# Altium schematic sheet MONO65_A2_s03 [MCU].SchDoc
size A3; DocumentNumber: 3; SheetNumber: 3; SheetTotal: 7
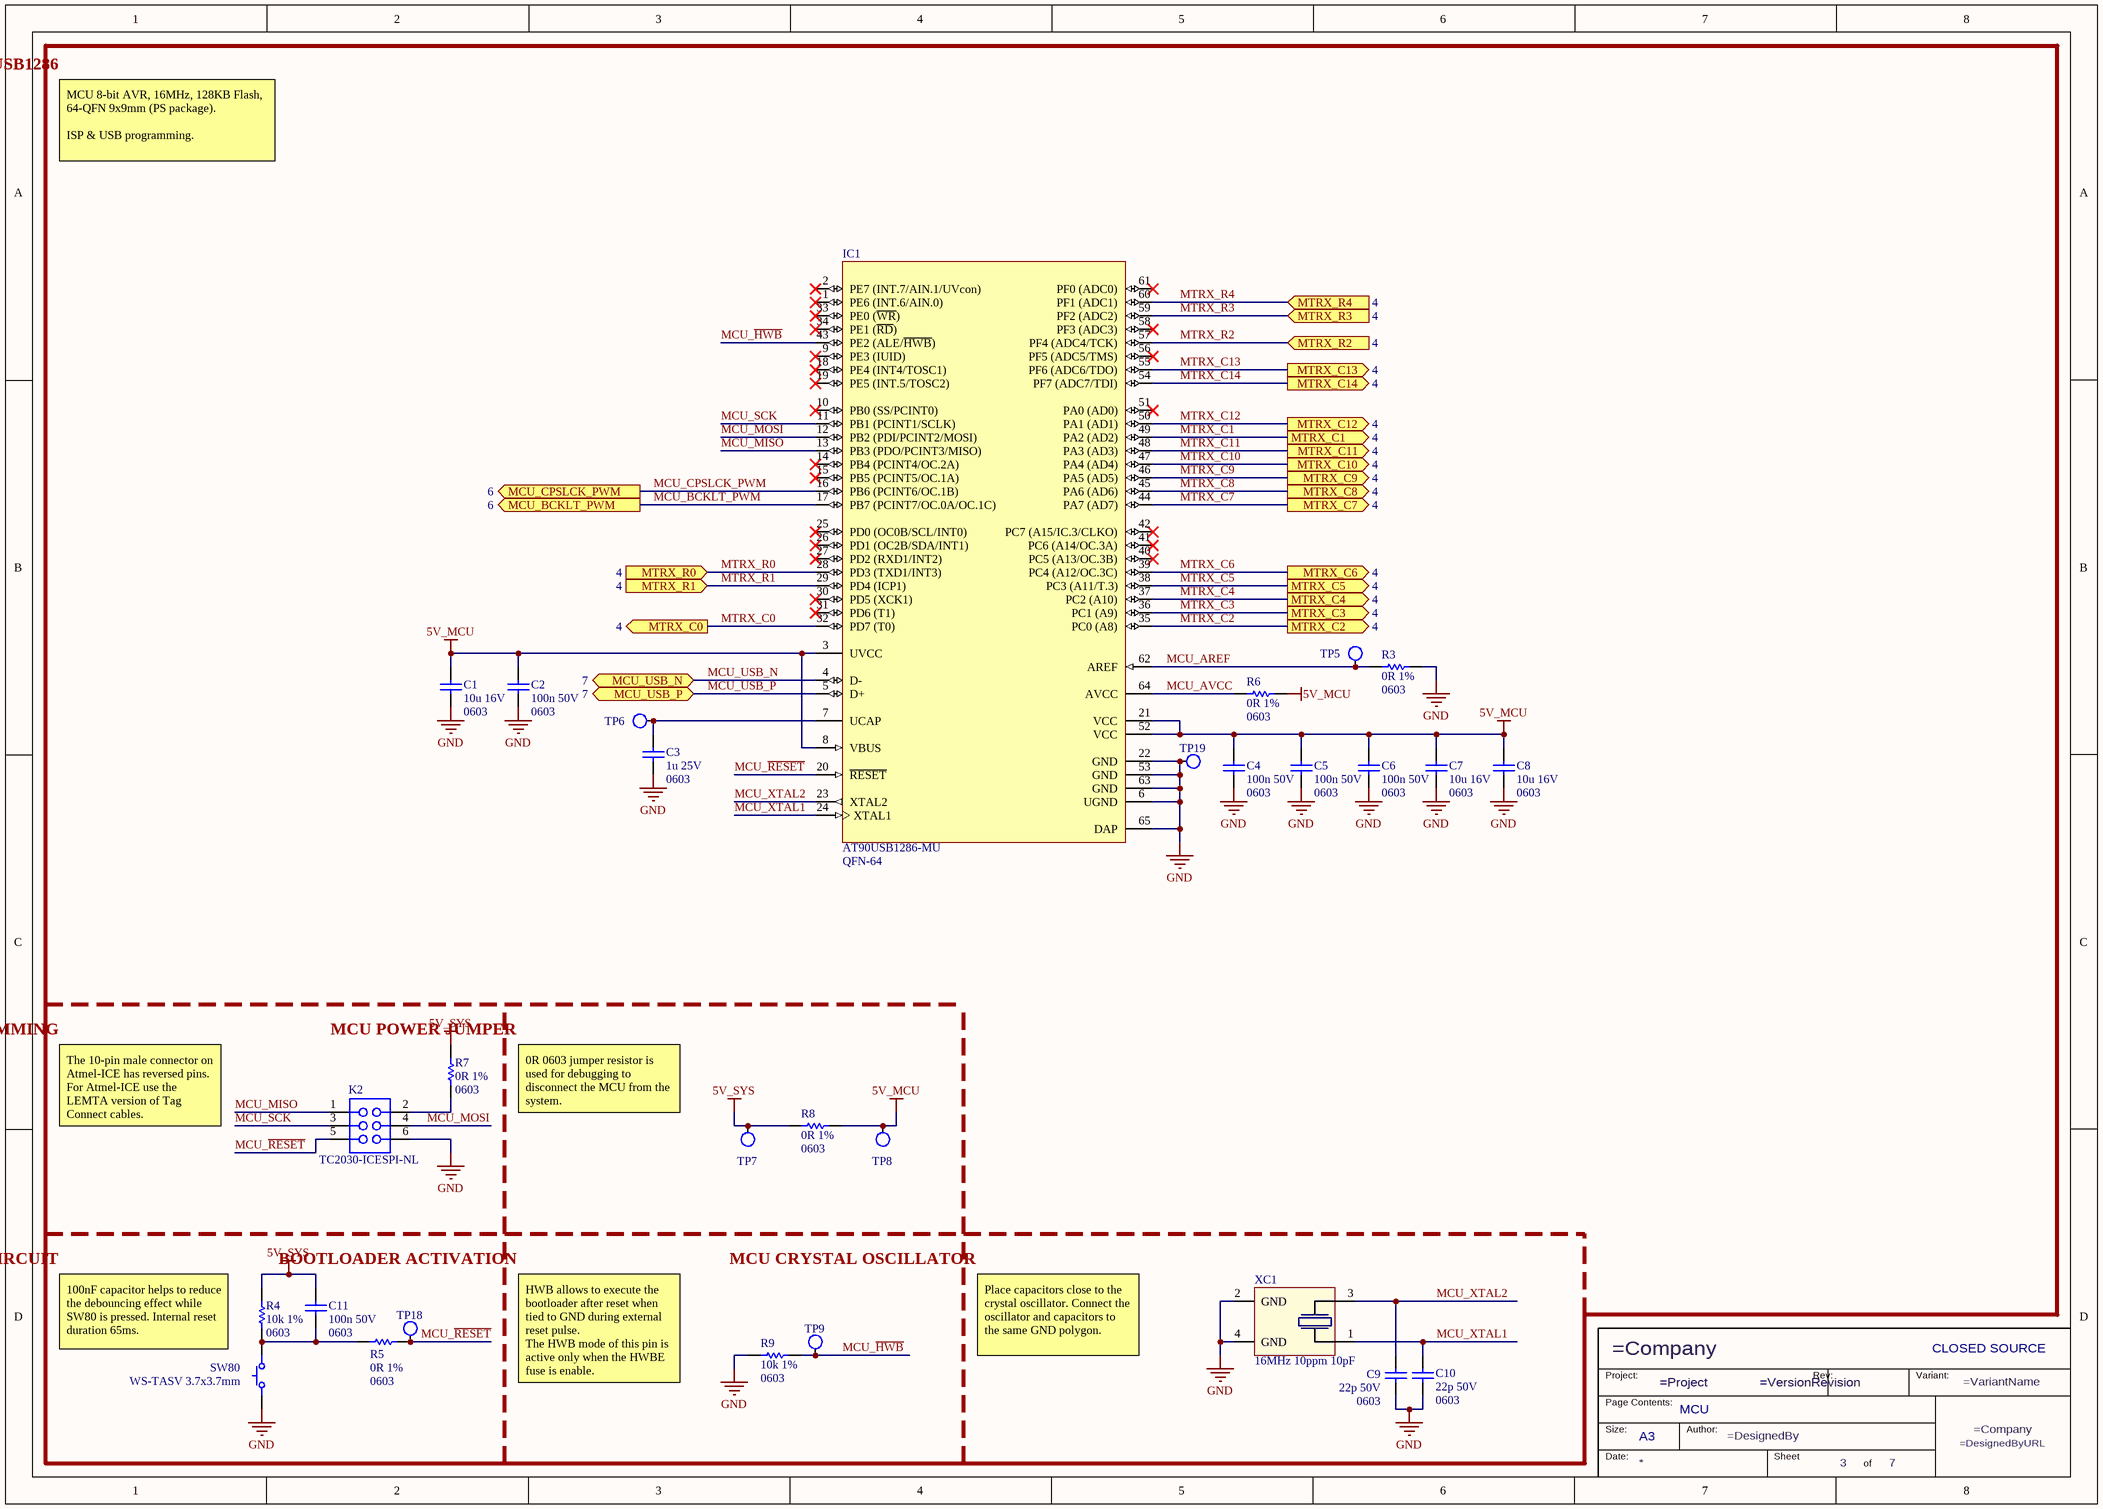
[diagram p0: MONO65_A2_s03 [MCU].SchDoc]

## Parts
C1  10u 16V  Case/Package: 0603  [CAPC1608X08N]
C2  100n 50V  Case/Package: 0603  [CAPC1608X08N]
C3  1u 25V  Case/Package: 0603  [CAPC1608X08N]
C4  100n 50V  Case/Package: 0603  [CAPC1608X08N]
C5  100n 50V  Case/Package: 0603  [CAPC1608X08N]
C6  100n 50V  Case/Package: 0603  [CAPC1608X08N]
C7  10u 16V  Case/Package: 0603  [CAPC1608X08N]
C8  10u 16V  Case/Package: 0603  [CAPC1608X08N]
C9  22p 50V  Case/Package: 0603  [CAPC1608X08N]
C10  22p 50V  Case/Package: 0603  [CAPC1608X08N]
C11  100n 50V  Case/Package: 0603  [CAPC1608X08N]
IC1  AT90USB1286-MU  Case/Package: QFN-64  [QFN50P900X900X100_HS-65N]
K2  TC2030-ICESPI-NL  [TC2030-6pin-NL]  (no BOM)
R3  0R 1%  Case/Package: 0603  [RESC1608X04N]
R4  10k 1%  Case/Package: 0603  [RESC1608X04N]
R5  0R 1%  Case/Package: 0603  [RESC1608X04N]
R6  0R 1%  Case/Package: 0603  [RESC1608X04N]
R7  0R 1%  Case/Package: 0603  [RESC1608X04N]
R8  0R 1%  Case/Package: 0603  [RESC1608X04N]
R9  10k 1%  Case/Package: 0603  [RESC1608X04N]
SW80  WS-TASV 3.7x3.7mm  [SWC WS-TASV J-Bend 3.7x3.7mm]
TB*?  PageContents: MCU  Licence: CLOSED SOURCE  Size: A3  (hidden comment: TBL TitleBlock 01)  (graphical)
TP5  TP SMD 0.6mm  [TP SMD 0.6mm]  (value not drawn)  (no BOM)
TP6  TP SMD 0.6mm  [TP SMD 0.6mm]  (value not drawn)  (no BOM)
TP7  TP SMD 0.6mm  [TP SMD 0.6mm]  (value not drawn)  (no BOM)
TP8  TP SMD 0.6mm  [TP SMD 0.6mm]  (value not drawn)  (no BOM)
TP9  TP SMD 0.6mm  [TP SMD 0.6mm]  (value not drawn)  (no BOM)
TP18  TP SMD 0.6mm  [TP SMD 0.6mm]  (value not drawn)  (no BOM)
TP19  TP SMD 0.6mm  [TP SMD 0.6mm]  (value not drawn)  (no BOM)
XC1  16MHz 10ppm 10pF  [Crystal Oscillator SMD 3225]

## Ports
MCU_BCKLT_PWM (out, see 6), MCU_CPSLCK_PWM (out, see 6), MCU_USB_N (bidir, see 7), MCU_USB_P (bidir, see 7), MTRX_C0 (out, see 4), MTRX_C1 (out, see 4), MTRX_C2 (out, see 4), MTRX_C3 (out, see 4), MTRX_C4 (out, see 4), MTRX_C5 (out, see 4), MTRX_C6 (out, see 4), MTRX_C7 (out, see 4), MTRX_C8 (out, see 4), MTRX_C9 (out, see 4), MTRX_C10 (out, see 4), MTRX_C11 (out, see 4), MTRX_C12 (out, see 4), MTRX_C13 (out, see 4), MTRX_C14 (out, see 4), MTRX_R0 (in, see 4), MTRX_R1 (in, see 4), MTRX_R2 (in, see 4), MTRX_R3 (in, see 4), MTRX_R4 (in, see 4)

## Nets
5V_MCU: C1.1 C2.1 C4.1 C5.1 C6.1 C7.1 C8.1 IC1.3(UVCC) IC1.8(VBUS) IC1.21(VCC) IC1.52(VCC) R6.2 R8.2 TP8.1
5V_SYS: C11.1 R4.1 R7.1 R8.1 TP7.1
GND: C1.2 C2.2 C3.2 C4.2 C5.2 C6.2 C7.2 C8.2 C9.2 C10.2 IC1.6(UGND) IC1.22(GND) IC1.53(GND) IC1.63(GND) IC1.65(DAP) K2.6 R3.2 R9.1 SW80.2 TP19.1 XC1.2(GND) XC1.4(GND)
MCU_AREF: IC1.62(AREF) R3.1 TP5.1
MCU_AVCC: IC1.64(AVCC) R6.1
MCU_BCKLT_PWM: IC1.17(PB7_(PCINT7/OC.0A/OC.1C)) ; port MCU_BCKLT_PWM
MCU_CPSLCK_PWM: IC1.16(PB6_(PCINT6/OC.1B)) ; port MCU_CPSLCK_PWM
MCU_~{HWB}: IC1.43(PE2_(ALE/~{HWB})) R9.2 TP9.1
MCU_MISO: IC1.13(PB3_(PDO/PCINT3/MISO)) K2.1
MCU_MOSI: IC1.12(PB2_(PDI/PCINT2/MOSI)) K2.4
MCU_~{RESET}: IC1.20(~{RESET}) K2.5 R5.2 TP18.1
MCU_SCK: IC1.11(PB1_(PCINT1/SCLK)) K2.3
MCU_USB_N: IC1.4(D-) ; port MCU_USB_N
MCU_USB_P: IC1.5(D+) ; port MCU_USB_P
MCU_XTAL1: C10.1 IC1.24(XTAL1) XC1.1
MCU_XTAL2: C9.1 IC1.23(XTAL2) XC1.3
MTRX_C0: IC1.32(PD7_(T0)) ; port MTRX_C0
MTRX_C1: IC1.49(PA2_(AD2)) ; port MTRX_C1
MTRX_C2: IC1.35(PC0_(A8)) ; port MTRX_C2
MTRX_C3: IC1.36(PC1_(A9)) ; port MTRX_C3
MTRX_C4: IC1.37(PC2_(A10)) ; port MTRX_C4
MTRX_C5: IC1.38(PC3_(A11/T.3)) ; port MTRX_C5
MTRX_C6: IC1.39(PC4_(A12/OC.3C)) ; port MTRX_C6
MTRX_C7: IC1.44(PA7_(AD7)) ; port MTRX_C7
MTRX_C8: IC1.45(PA6_(AD6)) ; port MTRX_C8
MTRX_C9: IC1.46(PA5_(AD5)) ; port MTRX_C9
MTRX_C10: IC1.47(PA4_(AD4)) ; port MTRX_C10
MTRX_C11: IC1.48(PA3_(AD3)) ; port MTRX_C11
MTRX_C12: IC1.50(PA1_(AD1)) ; port MTRX_C12
MTRX_C13: IC1.55(PF6_(ADC6/TDO)) ; port MTRX_C13
MTRX_C14: IC1.54(PF7_(ADC7/TDI)) ; port MTRX_C14
MTRX_R0: IC1.28(PD3_(TXD1/INT3)) ; port MTRX_R0
MTRX_R1: IC1.29(PD4_(ICP1)) ; port MTRX_R1
MTRX_R2: IC1.57(PF4_(ADC4/TCK)) ; port MTRX_R2
MTRX_R3: IC1.59(PF2_(ADC2)) ; port MTRX_R3
MTRX_R4: IC1.60(PF1_(ADC1)) ; port MTRX_R4
NetC3_1: C3.1 IC1.7(UCAP) TP6.1
NetC11_2: C11.2 R4.2 R5.1 SW80.1
NetK2_2: K2.2 R7.2

Not connected (* = marked no-connect by the designer): IC1 1(PE6_(INT.6/AIN.0))* 2(PE7_(INT.7/AIN.1/UVcon))* 9(PE3_(IUID))* 10(PB0_(SS/PCINT0))* 14(PB4_(PCINT4/OC.2A))* 15(PB5_(PCINT5/OC.1A))* 18(PE4_(INT4/TOSC1))* 19(PE5_(INT.5/TOSC2))* 25(PD0_(OC0B/SCL/INT0))* 26(PD1_(OC2B/SDA/INT1))* 27(PD2_(RXD1/INT2))* 30(PD5_(XCK1))* 31(PD6_(T1))* 33(PE0_(~{WR}))* 34(PE1_(~{RD}))* 40(PC5_(A13/OC.3B))* 41(PC6_(A14/OC.3A))* 42(PC7_(A15/IC.3/CLKO))* 51(PA0_(AD0))* 56(PF5_(ADC5/TMS))* 58(PF3_(ADC3))* 61(PF0_(ADC0))*

## Notes on the sheet
- MCU AT90USB1286
- MCU 8-bit AVR, 16MHz, 128KB Flash, 64-QFN 9x9mm (PS package).
  ISP & USB programming.
- ISP (SPI) PROGRAMMING
- MCU POWER JUMPER
- The 10-pin male connector on Atmel-ICE has reversed pins. For Atmel-ICE use the LEMTA version of Tag Connect cables.
- 0R 0603 jumper resistor is used for debugging to disconnect the MCU from the system.
- MCU RESET CIRCUIT
- BOOTLOADER ACTIVATION
- MCU CRYSTAL OSCILLATOR
- 100nF capacitor helps to reduce the debouncing effect while SW80 is pressed. Internal reset duration 65ms.
- HWB allows to execute the bootloader after reset when tied to GND during external
  reset pulse.
  The HWB mode of this pin is active only when the HWBE fuse is enable.
- Place capacitors close to the crystal oscillator. Connect the oscillator and capacitors to the same GND polygon.
- (in symbol TBL TitleBlock 01) Project:; Rev:; Variant:; Page Contents:; Size:; Author:; Date:; Sheet; of

## Library data of the parts
C1 C7 C8 = CAP SMD CER 10u 16V X5R 0603: SMD CAPACITOR,10u, 16V, X5R, 0603; Manufacturer: Murata; Manufacturer Part Number: GRM188R61C106MA73D; Capacitance: 10uF; Tolerance: 20%; Supplier 1: Digi-Key; Stock 1: 24451; Pricing 1: 1 = 0,31000, 10 = 0,21500, 50 = 0,14340, 100 = 0,12190, 500 = 0,08604, 1000 = 0,07528 (USD); RoHS: Yes; Mount: Surface Mount; Case Code (Metric): 1608; Case Code (Imperial): 0603; Min Operating Temperature: -55°C; Max Operating Temperature: 85°C; Package Quantity: 4000; Packaging: Tape and Reel; Voltage Rating: 16V; Dielectric: X5R; Voltage: 16V; Voltage Rating (DC): 16V; Series: GRM; Length: 1.6mm; Width: 0.031inch; Height: 0.8mm; Thickness: 0.031inch; Depth: 0.8mm; REACH SVHC: No SVHC; Lead Free: Lead Free; RoHS Compliant: Yes; ComponentLink1URL: https://datasheet.ciiva.com/46444/1769893-46444981.pdf?src-supplier=Element14; ComponentLink1Description: https://datasheet.ciiva.com/46444/1769893-46444981.pdf?src-supplier=Element14; ComponentLink2URL: https://datasheet.ciiva.com/14906/partnumbering-e-01-14906479.pdf?src-supplier=Digi-Key; ComponentLink2Description: https://datasheet.ciiva.com/14906/partnumbering-e-01-14906479.pdf?src-supplier=Digi-Key; Supplier Part Number 1: 490-7201-1-ND
C2 C4-C6 C11 = CAP SMD CER 100n 50V X7R 0603: SMD CAPACITOR, 100n, 50V, X7R, 0603; Manufacturer: TDK; Manufacturer Part Number: CGA3E2X7R1H104K080AA; Capacitance: 100nF; Tolerance: 10%; Supplier 1: Digi-Key; Stock 1: 8773520; Pricing 1: 1 = 0,11000, 10 = 0,07900, 100 = 0,03510, 500 = 0,02510, 1000 = 0,01972 (USD); RoHS: Yes; Mount: Surface Mount; Weight: 7.1E-05oz; Case Code (Imperial): 0603; Case Code (Metric): 1608; Min Operating Temperature: -55°C; Max Operating Temperature: 125°C; Packaging: Tape and Reel; Voltage Rating: 50V; Dielectric: X7R; Package Quantity: 1; Termination: SMD/SMT; Voltage Rating (DC): 50V; Voltage: 50V; Composition: Ceramic; Length: 1.6mm; Height: 0.8mm; Width: 0.8mm; Thickness: 0.035inch; Depth: 0.8mm; Ratings: AEC-Q200; Radiation Hardening: No; REACH SVHC: No SVHC; Lead Free: Lead Free; ComponentLink1URL: https://datasheet.ciiva.com/24216/cga3e2x7r1h104k080aa-266291-24216208.pdf?src-supplier=Mouser; ComponentLink1Description: https://datasheet.ciiva.com/24216/cga3e2x7r1h104k080aa-266291-24216208.pdf?src-supplier=Mouser; ComponentLink2URL: https://datasheet.ciiva.com/15192/getdatasheetpartid-715867-15192412.pdf?src-supplier=Verical; ComponentLink2Description: https://datasheet.ciiva.com/15192/getdatasheetpartid-715867-15192412.pdf?src-supplier=Verical; ComponentLink3URL: https://datasheet.ciiva.com/16500/mlccspec-automotive-general-midvoltage-en-16500693.pdf?src-supplier=Future+Electronics; ComponentLink3Description: https://datasheet.ciiva.com/16500/mlccspec-automotive-general-midvoltage-en-16500693.pdf?src-supplier=Future+Electronics; ComponentLink4URL: https://datasheet.ciiva.com/22725/1735392-22725642.pdf?src-supplier=Element14; ComponentLink4Description: https://datasheet.ciiva.com/22725/1735392-22725642.pdf?src-supplier=Element14; ComponentLink5URL: https://datasheet.ciiva.com/23803/1936565-23803084.pdf?src-supplier=Newark; ComponentLink5Description: https://datasheet.ciiva.com/23803/1936565-23803084.pdf?src-supplier=Newark; ComponentLink6URL: https://datasheet.ciiva.com/46385/1735392-46385708.pdf?src-supplier=Element14; ComponentLink6Description: https://datasheet.ciiva.com/46385/1735392-46385708.pdf?src-supplier=Element14; Supplier Part Number 1: 445-5666-1-ND
C3 = CAP SMD CER 1u 25V X7R 0603: SMD CAPACITOR, 1µF, 25V, X7R, 0603; Manufacturer: KEMET; Manufacturer Part Number: C0603C105K3RACTU; Dielectric Material: Ceramic; Capacitance: 1uF; Tolerance: 10%; Dissipation Factor: 5%; Supplier 1: Digi-Key; Stock 1: 271609; Pricing 1: 1 = 0,30000, 10 = 0,20900, 100 = 0,11830, 500 = 0,08350, 1000 = 0,07307 (USD); RoHS: Yes; Mount: Surface Mount; Case Code (Metric): 1608; Case Code (Imperial): 0603; Min Operating Temperature: -55°C; Max Operating Temperature: 125°C; Voltage Rating: 25V; Packaging: Tape and Reel; Dielectric: X7R; Voltage Rating (DC): 25V; Package Quantity: 1; Termination: SMD/SMT; Voltage: 25V; Length: 1.6mm; Height: 0.8mm; Width: 0.031inch; Thickness: 0.034inch; Depth: 0.8mm; REACH SVHC: No SVHC; ComponentLink1URL: https://datasheet.ciiva.com/7823/1851736-7823596.pdf?src-supplier=Element14; ComponentLink1Description: https://datasheet.ciiva.com/7823/1851736-7823596.pdf?src-supplier=Element14; Supplier Part Number 1: 399-7376-1-ND
C9 C10 = CAP SMD CER 22p 50V NP0 0603: SMD CAPACITOR, 22p, 50V, C0G/NP0, 0603; Manufacturer: Kyocera AVX; Manufacturer Part Number: 06035A220JAT2A; Dielectric Material: Ceramic; Capacitance: 22pF; Tolerance: 5%; Dielectric: C0G; Insulation Resistance: 100GR; Temperature Coefficient: 30ppm/°C; Supplier 1: Digi-Key; Stock 1: 1291683; Pricing 1: 1 = 0,10000, 10 = 0,05600, 50 = 0,03040, 100 = 0,02480, 500 = 0,01772, 1000 = 0,01392 (USD); RoHS: Yes; Mount: Surface Mount,PCB; Number of Pins: 2; Case Code (Imperial): 0603; Case Code (Metric): 1608; Contact Plating: Tin,Matte; Min Operating Temperature: -55°C; Max Operating Temperature: 125°C; Packaging: Tape and Reel; Voltage Rating: 50V; Voltage Rating (DC): 50V; Termination: SMD/SMT; Voltage: 50V; Package Quantity: 1; Length: 1.6mm; Width: 0.81mm; Height: 0.63mm; Thickness: 0.035inch; Depth: 0.81mm; Radiation Hardening: No; REACH SVHC: No SVHC; RoHS Compliant: Yes; Lead Free: Lead Free; ComponentLink1URL: https://datasheet.ciiva.com/11788/0900766b802d4697-11788031.pdf?src-supplier=RSComponents; ComponentLink1Description: https://datasheet.ciiva.com/11788/0900766b802d4697-11788031.pdf?src-supplier=RSComponents; ComponentLink2URL: https://datasheet.ciiva.com/16351/ccog-16351125.pdf?src-supplier=Future+Electronics; ComponentLink2Description: https://datasheet.ciiva.com/16351/ccog-16351125.pdf?src-supplier=Future+Electronics; ComponentLink3URL: https://datasheet.ciiva.com/7855/759117-7855064.pdf?src-supplier=Element14; ComponentLink3Description: https://datasheet.ciiva.com/7855/759117-7855064.pdf?src-supplier=Element14; ComponentLink4URL: https://datasheet.ciiva.com/150/ccog-150366.pdf?src-supplier=Digi-Key; ComponentLink4Description: https://datasheet.ciiva.com/150/ccog-150366.pdf?src-supplier=Digi-Key; ComponentLink5URL: https://datasheet.ciiva.com/150/ccog-150367.pdf?src-supplier=Digi-Key; ComponentLink5Description: https://datasheet.ciiva.com/150/ccog-150367.pdf?src-supplier=Digi-Key; ComponentLink6URL: https://datasheet.ciiva.com/1124/759117-1124728.pdf?src-supplier=Element14; ComponentLink6Description: https://datasheet.ciiva.com/1124/759117-1124728.pdf?src-supplier=Element14; Supplier Part Number 1: 478-1167-1-ND
IC1 = MCU AT90USB1286-MU: MCU 8-bit AVR, 16MHz, 128KB Flash, 64-QFN 9x9mm (PS package); Manufacturer: Microchip / Atmel; Interface: SPI,Serial,USB,USART,2-Wire,I2C,UART,EBI/EMI; RAM Size: 8KB; Max Supply Voltage: 5.5V; Min Supply Voltage: 2.7V; Number of ADC Channels: 8; Number of PWM Channels: 10; Number of Timers/Counters: 4; Number of I/Os: 48; Data Bus Width: 8b; Max Frequency: 20MHz; Number of SPI Channels: 1; Oscillator Type: Internal; Watchdog Timer: Yes; Peripherals: POR,PWM,WDT,Brown-out Detect/Reset; Supplier 1: RSComponents; Manufacturer Part Number: AT90USB1286-MU; Stock 1: 0; RoHS: Yes; Mount: Surface Mount; Number of Pins: 64; Min Operating Temperature: -40°C; Max Operating Temperature: 85°C; Frequency: 16MHz; Packaging: Tray; Package Quantity: 1300; Number of Programmable I/O: 48; Number of I2C Channels: 1; Address Bus Width: 8b; Memory Type: FLASH; Memory Size: 128KB; Core Architecture: AVR; Series: AVR®; Length: 9mm; Width: 9mm; Height: 1mm; Radiation Hardening: No; REACH SVHC: No SVHC; Lead Free: Lead Free; RoHS Compliant: Yes; ComponentLink1URL: https://datasheet.ciiva.com/26927/getdatasheetpartid-364802-26927386.pdf?src-supplier=Verical; ComponentLink1Description: https://datasheet.ciiva.com/26927/getdatasheetpartid-364802-26927386.pdf?src-supplier=Verical; ComponentLink2URL: https://datasheet.ciiva.com/1651/doc7593-1651388.pdf?src-supplier=Digi-Key; ComponentLink2Description: https://datasheet.ciiva.com/1651/doc7593-1651388.pdf?src-supplier=Digi-Key; ComponentLink3URL: https://datasheet.ciiva.com/14132/at90usb646-7-1286-7-eng-tds-14132493.pdf?src-supplier=Distrelec; ComponentLink3Description: https://datasheet.ciiva.com/14132/at90usb646-7-1286-7-eng-tds-14132493.pdf?src-supplier=Distrelec; Supplier Part Number 1: 1278162
K2 = CON B2W HYB TC2030-ICESPI-NL-LEMTA: TC2030-ICESPI-NL-LEMTA 6-Pin “No Legs” PCB points for 10-pin micro-connector for AVR processors. LEMTA = reversed pins. Suitable for Atmel ICE.
R3 R5-R8 = RES SMD 0R 1% 0603: SMD RESISTOR 0R 1% 0603 0.1W; Manufacturer: Yageo; Manufacturer Part Number: RC0603JR-070RL; Resistance: 0mR; Power Rating: 100mW; Voltage Rating: 50V; Temperature Coefficient: 200ppm/°C; Supplier 1: Digi-Key; Stock 1: 22182575; Pricing 1: 1 = 0,10000, 10 = 0,01900, 25 = 0,01360, 50 = 0,01040, 100 = 0,00770, 250 = 0,00588, 500 = 0,00472, 1000 = 0,00347 (USD); RoHS: Yes; Number of Pins: 2; Case Code (Imperial): 0603; Case Code (Metric): 1608; Contact Plating: Tin,Matte; Min Operating Temperature: -55°C; Max Operating Temperature: 155°C; Packaging: Tape and Reel; Voltage Rating (DC): 50V; Composition: Thick Film; Tolerance: 1%; Military Standard: Not; Package Quantity: 5000; Termination: SMD/SMT; Length: 1.6mm; Height: 0.45mm; Width: 0.8mm; Depth: 0.8mm; Radiation Hardening: No; REACH SVHC: No SVHC; Lead Free: Lead Free; ComponentLink1URL: https://datasheet.ciiva.com/11808/pyu-r-int-6-11808700.pdf?src-supplier=RSComponents; ComponentLink1Description: https://datasheet.ciiva.com/11808/pyu-r-int-6-11808700.pdf?src-supplier=RSComponents; ComponentLink2URL: https://datasheet.ciiva.com/7746/1738695-7746421.pdf?src-supplier=Element14; ComponentLink2Description: https://datasheet.ciiva.com/7746/1738695-7746421.pdf?src-supplier=Element14; ComponentLink3URL: https://datasheet.ciiva.com/8883/pyu-rc0603-51-rohs-l-4-8883045.pdf?src-supplier=Avnet; ComponentLink3Description: https://datasheet.ciiva.com/8883/pyu-rc0603-51-rohs-l-4-8883045.pdf?src-supplier=Avnet; ComponentLink4URL: https://datasheet.ciiva.com/15189/getdatasheetpartid-329462-15189845.pdf?src-supplier=Verical; ComponentLink4Description: https://datasheet.ciiva.com/15189/getdatasheetpartid-329462-15189845.pdf?src-supplier=Verical; ComponentLink5URL: https://datasheet.ciiva.com/7746/1738695-7746422.pdf?src-supplier=Element14; ComponentLink5Description: https://datasheet.ciiva.com/7746/1738695-7746422.pdf?src-supplier=Element14; ComponentLink6URL: https://datasheet.ciiva.com/12555/rc0603-272842-12555254.pdf?src-supplier=Mouser; ComponentLink6Description: https://datasheet.ciiva.com/12555/rc0603-272842-12555254.pdf?src-supplier=Mouser; ComponentLink7URL: https://datasheet.ciiva.com/22747/443971-22747530.pdf?src-supplier=Element14; ComponentLink7Description: https://datasheet.ciiva.com/22747/443971-22747530.pdf?src-supplier=Element14; Supplier Part Number 1: 311-0.0GRDKR-ND
R4 R9 = RES SMD 10k 1% 0603: SMD RESISTOR 10k 1% 0603 0.1W; Manufacturer: Panasonic; Manufacturer Part Number: ERJ-3EKF1002V; Resistance: 10kR; Power Rating: 100mW; Temperature Coefficient: 100ppm/°C; Voltage Rating: 75V; Supplier 1: Digi-Key; Stock 1: 1973326; Pricing 1: 1 = 0,10000, 10 = 0,06000, 100 = 0,02440, 1000 = 0,01094, 2500 = 0,00950 (USD); RoHS: Yes; Mount: Surface Mount; Number of Pins: 2; Case Code (Metric): 1608; Case Code (Imperial): 0603; Contact Plating: Tin; Min Operating Temperature: -55°C; Max Operating Temperature: 155°C; Tolerance: 1%; Packaging: Tape and Reel; Composition: Thick Film; Termination: SMD/SMT; Package Quantity: 1; Max Power Dissipation: 100mW; Military Standard: Not; Number of Terminations: 2; Voltage Rating (DC): 75V; Features: Automotive AEC-Q200; Length: 1.6mm; Height: 0.45mm; Width: 0.031inch; Depth: 0.8mm; Radiation Hardening: No; Lead Free: Lead Free; REACH SVHC: No SVHC; ComponentLink1URL: https://datasheet.ciiva.com/7830/aoa0000ce2-7830729.pdf?src-supplier=Element14; ComponentLink1Description: https://datasheet.ciiva.com/7830/aoa0000ce2-7830729.pdf?src-supplier=Element14; ComponentLink2URL: https://datasheet.ciiva.com/17212/aoa0000ce2-17212105.pdf?src-supplier=Avnet+Europe; ComponentLink2Description: https://datasheet.ciiva.com/17212/aoa0000ce2-17212105.pdf?src-supplier=Avnet+Europe; ComponentLink3URL: https://datasheet.ciiva.com/48530/aoa0000ce2-48530988.pdf?src-supplier=Avnet; ComponentLink3Description: https://datasheet.ciiva.com/48530/aoa0000ce2-48530988.pdf?src-supplier=Avnet; ComponentLink4URL: https://datasheet.ciiva.com/24070/aoa0000ce2-24070318.pdf?src-supplier=Mouser; ComponentLink4Description: https://datasheet.ciiva.com/24070/aoa0000ce2-24070318.pdf?src-supplier=Mouser; ComponentLink5URL: https://datasheet.ciiva.com/16759/70260748-16759807.pdf?src-supplier=Allied+Electronics; ComponentLink5Description: https://datasheet.ciiva.com/16759/70260748-16759807.pdf?src-supplier=Allied+Electronics; ComponentLink6URL: https://datasheet.ciiva.com/16511/aoa0000ce2-16511861.pdf?src-supplier=Avnet+Asia; ComponentLink6Description: https://datasheet.ciiva.com/16511/aoa0000ce2-16511861.pdf?src-supplier=Avnet+Asia; ComponentLink7URL: https://datasheet.ciiva.com/46372/1678782-46372725.pdf?src-supplier=Element14; ComponentLink7Description: https://datasheet.ciiva.com/46372/1678782-46372725.pdf?src-supplier=Element14; ComponentLink8URL: https://datasheet.ciiva.com/28514/426256-28514198.pdf?src-supplier=Element14; ComponentLink8Description: https://datasheet.ciiva.com/28514/426256-28514198.pdf?src-supplier=Element14; ComponentLink9URL: https://datasheet.ciiva.com/9194/aoa0000ce2-9194199.pdf?src-supplier=Avnet; ComponentLink9Description: https://datasheet.ciiva.com/9194/aoa0000ce2-9194199.pdf?src-supplier=Avnet; ComponentLink10URL: https://datasheet.ciiva.com/30208/aoa0000ce2-30208985.pdf?src-supplier=Onlinecomponents.com; ComponentLink10Description: https://datasheet.ciiva.com/30208/aoa0000ce2-30208985.pdf?src-supplier=Onlinecomponents.com; Supplier Part Number 1: P10.0KHDKR-ND
SW80 = SWC 430173003816: WS-TASV J-Bend SMT Tact Switch 3.7x3.7mm. 12 V (DC) 50mA. 500000 Cycles.; Manufacturer: Wurth Electronics; Supplier 1: Mouser; Manufacturer Part Number: 430173003816; Stock 1: 9733; Pricing 1: 1 = 0,51000, 10 = 0,48600, 50 = 0,42000, 100 = 0,42000, 1000 = 0,36800, 10000 = 0,36800 (USD); RoHS: No; Supplier Part Number 1: 710-430173003816
TB*? = TBL TitleBlock 01: Custom Title block
TP5-TP9 TP18 TP19 = TPT SMD 60: Test Point SMD 0.6mm
XC1 = CYR SMD 16MHz MCSJK-7U-16.00-10-10-80-B-10: Crystal Resonator, 16MHz, 10pF, 3.2mm X 2.5mm, SMD; Manufacturer: Multicomp; Supplier 1: Farnell; Manufacturer Part Number: MCSJK-7U-16.00-10-10-80-B-10; Stock 1: 69101; Pricing 1: 5 = 0,21300, 50 = 0,17300, 250 = 0,15200, 500 = 0,13800 (EUR); RoHS: No; Supplier Part Number 1: 2853934; Case/Package: SMD 3225